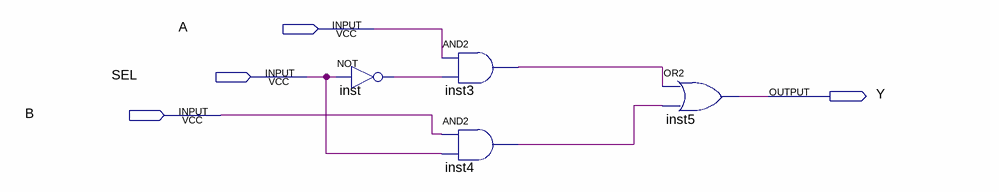
[diagram p0: schematic sheet]
// Quartus schematic mux2_1.bdf as structural Verilog: 4 symbols, 4 pins
module mux2_1 (
  input  A,
  input  SEL,
  input  B,
  output Y
);

  wire inst3_out, inst4_out, inst_out;

  not inst (inst_out, SEL);
  and inst3 (inst3_out, A, inst_out);
  and inst4 (inst4_out, B, SEL);
  or inst5 (Y, inst3_out, inst4_out);
endmodule
